# Altium schematic sheet Connector_Section.SchDoc
size A; DocumentNumber: 13; SheetNumber: 13; SheetTotal: 13
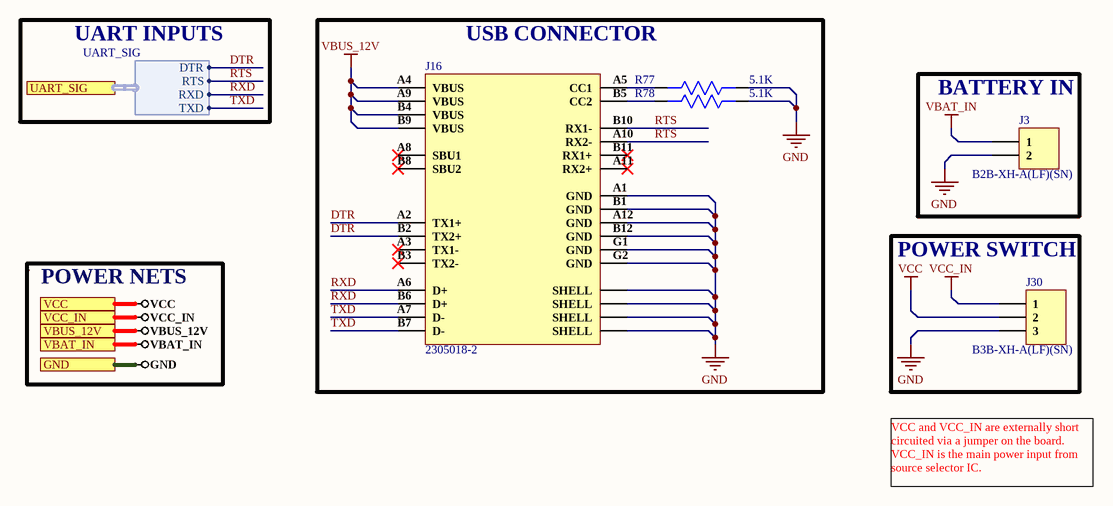
[diagram p0: Connector_Section.SchDoc]

## Parts
J3  B2B-XH-A(LF)(SN)  [B2B-XH-A(LF)(SN)]
J16  2305018-2  [2305018-2]
J30  B3B-XH-A(LF)(SN)  [B3B-XH-A(LF)(SN)]
R77  5.1K  [RES-0603]
R78  5.1K  [RES-0603]

## Blocks framed on the sheet
USB CONNECTOR: J16 R77 R78
BATTERY IN: J3
POWER SWITCH: J30

## Ports
GND, UART_SIG (harness UART_SIG), VBAT_IN, VBUS_12V, VCC, VCC_IN

## Harnesses
UART_SIG: RXD, TXD, DTR, RTS

## Nets
GND: J3.2 J16.A1(GND) J16.A12(GND) J16.B1(GND) J16.B12(GND) J16.G1(GND) J16.G2(GND) J16.S1(SHELL) J16.S2(SHELL) J16.S3(SHELL) J16.S4(SHELL) J30.3 R77.1 R78.1 ; port GND
VBAT_IN: J3.1 ; port VBAT_IN
VBUS_12V: J16.A4(VBUS) J16.A9(VBUS) J16.B4(VBUS) J16.B9(VBUS) ; port VBUS_12V
VCC: J30.2 ; port VCC
VCC_IN: J30.1 ; port VCC_IN
DTR: J16.A2(TX1+) J16.B2(TX2+) ; port UART_SIG.DTR
RTS: J16.A10(RX2-) J16.B10(RX1-) ; port UART_SIG.RTS
RXD: J16.A6(D+) J16.B6(D+) ; port UART_SIG.RXD
TXD: J16.A7(D-) J16.B7(D-) ; port UART_SIG.TXD
NetJ16_A5: J16.A5(CC1) R77.2
NetJ16_B5: J16.B5(CC2) R78.2

Not connected (* = marked no-connect by the designer): J16 A3(TX1-)* A8(SBU1)* A11(RX2+)* B3(TX2-)* B8(SBU2)* B11(RX1+)*

## Notes on the sheet
- UART INPUTS
- POWER NETS
- VCC and VCC_IN are externally short circuited via a jumper on the board. VCC_IN is the main power input from source selector IC.

## Library data of the parts
J3 = B2B-XH-A(LF)(SN): Conn Shrouded Header (4 Sides) HDR 2 POS 2.5mm Solder ST Thru-Hole Box; Manufacturer: JST; Number of Positions: 2; Connector Type: Male Pin; Current Rating: 3A; Contact Resistance: 20mR; Voltage Rating: 250V; Insulation Resistance: 1GR; Wire/Cable Gauge: 22AWG; Supplier 1: Farnell; Manufacturer Part Number: B2B-XH-A(LF)(SN); RoHS: Yes; Category: FFC / FPC; Stock 1: 219240; Pricing 1: 100=0.06860, 1000=0.04800, 2500=0.04520, 5000=0.04230, 10000=0.03950, 20000=0.03660 (GBP); Mount: Through Hole; Contact Plating: Tin,Copper,Lead; Color: Natural; Contact Material: Brass; Housing Color: White; Housing Material: Polyamide; Min Operating Temperature: -25°C; Max Operating Temperature: 85°C; Number of Rows: 1; Packaging: Bulk; Termination: Solder; Fastening Type: Detent; Max Current Rating: 3A; Voltage Rating (AC): 250V; Max Voltage Rating (AC): 250V; Number of Contacts: 2; Max Voltage Rating (DC): 250V; Orientation: Straight; Length: 7.4mm; Pitch: 2.5mm; Lead Pitch: 2.5mm; Depth: 5.75mm; REACH SVHC: No SVHC; Lead Free: Lead Free; ComponentLink1URL: https://datasheet.ciiva.com/26894/getdatasheetpartid-640357-26894434.pdf?src-supplier=Verical; ComponentLink1Description: https://datasheet.ciiva.com/26894/getdatasheetpartid-640357-26894434.pdf?src-supplier=Verical; ComponentLink2URL: https://datasheet.ciiva.com/11746/0900766b8082653e-11746979.pdf?src-supplier=RSComponents; ComponentLink2Description: https://datasheet.ciiva.com/11746/0900766b8082653e-11746979.pdf?src-supplier=RSComponents; ComponentLink3URL: https://datasheet.ciiva.com/26894/getdatasheetpartid-385291-26894760.pdf?src-supplier=Verical; ComponentLink3Description: https://datasheet.ciiva.com/26894/getdatasheetpartid-385291-26894760.pdf?src-supplier=Verical; ComponentLink4URL: https://datasheet.ciiva.com/8052/5448-8052024.pdf?src-supplier=Element14; ComponentLink4Description: https://datasheet.ciiva.com/8052/5448-8052024.pdf?src-supplier=Element14; ComponentLink5URL: https://datasheet.ciiva.com/20207/523653-20207167.pdf?src-supplier=Rapid+Electronics; ComponentLink5Description: https://datasheet.ciiva.com/20207/523653-20207167.pdf?src-supplier=Rapid+Electronics; Supplier Part Number 1: 1516276
J16 = 2305018-2: CONN RCP USB3.1 TYPEC 24P SMD RA
J30 = B3B-XH-A(LF)(SN): CONN HEADER VERT 3POS 2.5MM; Manufacturer: JST; Current Rating: 3A; Number of Positions: 3; Voltage Rating (AC): 250V; Contact Resistance: 20mR; Insulation Resistance: 1GR; Gender: Male; Wire/Cable Gauge: 22AWG; Supplier 1: Digi-Key; Manufacturer Part Number: B3B-XH-A(LF)(SN); Stock 1: 3453; Pricing 1: 1=0.19, 10=0.181, 25=0.1344, 50=0.1154, 250=0.09612, 750=0.08652, 1000=0.08075, 12000=0.06152, 24000=0.05575 (USD); Mount: Through Hole; Contact Plating: Tin,Lead,Copper; Contact Material: Brass; Color: Natural; Housing Color: White; Housing Material: Polyamide; Contact Shape: Square; Contact Finish - Mating: TIN; Insulation Material: Nylon; Insulation Color: Natural; Min Operating Temperature: -25°C; Max Operating Temperature: 85°C; Number of Rows: 1; Packaging: Bulk; Termination: Solder; Connector Type: Header; Series: XH; Contact Type: Male Pin; Max Current Rating: 3A; Voltage Rating: 250V; Fastening Type: Detent; Number of Contacts: 3; Max Voltage Rating (AC): 250V; Max Voltage Rating (DC): 250V; Orientation: Straight; Length: 9.9mm; Pitch: 2.5mm; Lead Pitch: 2.5mm; Depth: 5.75mm; Lead Free: Lead Free; REACH SVHC: No SVHC; Flammability Rating: UL94 V-0; ComponentLink1URL: https://www.verical.com/server-webapp/html/getDatasheet?partID=640434&src-supplier=Verical; ComponentLink1Description: https://www.verical.com/server-webapp/html/getDatasheet?partID=640434&src-supplier=Verical; ComponentLink2URL: https://www.verical.com/server-webapp/html/getDatasheet?partID=440399&src-supplier=Verical; ComponentLink2Description: https://www.verical.com/server-webapp/html/getDatasheet?partID=440399&src-supplier=Verical; Supplier Part Number 1: 455-2248-ND
R77 R78 = RMCF0603FT5K10: RES 5.1K OHM 1% 1/10W 0603; Manufacturer: Stackpole Electronics; Resistance: 5.1kR; Max Power Dissipation: 100mW; Temperature Coefficient: 100ppm/°C; Supplier 1: Digi-Key; Manufacturer Part Number: RMCF0603FT5K10; Stock 1: 58341; Pricing 1: 1=0.1, 10=0.017, 100=0.0068, 1000=0.00305, 2500=0.00264 (USD); Mount: Surface Mount; Case/Package: 0603; Case Code (Metric): 1608; Case Code (Imperial): 0603; Contact Plating: Tin,Matte; Min Operating Temperature: -55°C; Max Operating Temperature: 155°C; Tolerance: 1%; Packaging: Tape and Reel; Resistor Type: Thick Film; Number of Terminations: 2; Features: Automotive AEC-Q200; Series: RMCF; Length: 0.061inch; Width: 0.031inch; Height: 0.022inch; Radiation Hardening: No; RoHS Compliant: Yes; ComponentLink1URL: https://www.seielect.com/catalog/SEI-RMCF_RMCP.pdf?src-supplier=Avnet; ComponentLink1Description: https://www.seielect.com/catalog/SEI-RMCF_RMCP.pdf?src-supplier=Avnet; ComponentLink2URL: http://components.arrow.com/part/dataview/50863347S9465827N1174?src-supplier=Arrow+Electronics; ComponentLink2Description: http://components.arrow.com/part/dataview/50863347S9465827N1174?src-supplier=Arrow+Electronics; ComponentLink3URL: https://www.seielect.com/catalog/SEI-Packaging.pdf?src-supplier=Digi-Key; ComponentLink3Description: https://www.seielect.com/catalog/SEI-Packaging.pdf?src-supplier=Digi-Key; Supplier Part Number 1: RMCF0603FT5K10DKR-ND